# Altium project MVP-Dash-v1.0.PrjPcb (part 14 of 15)
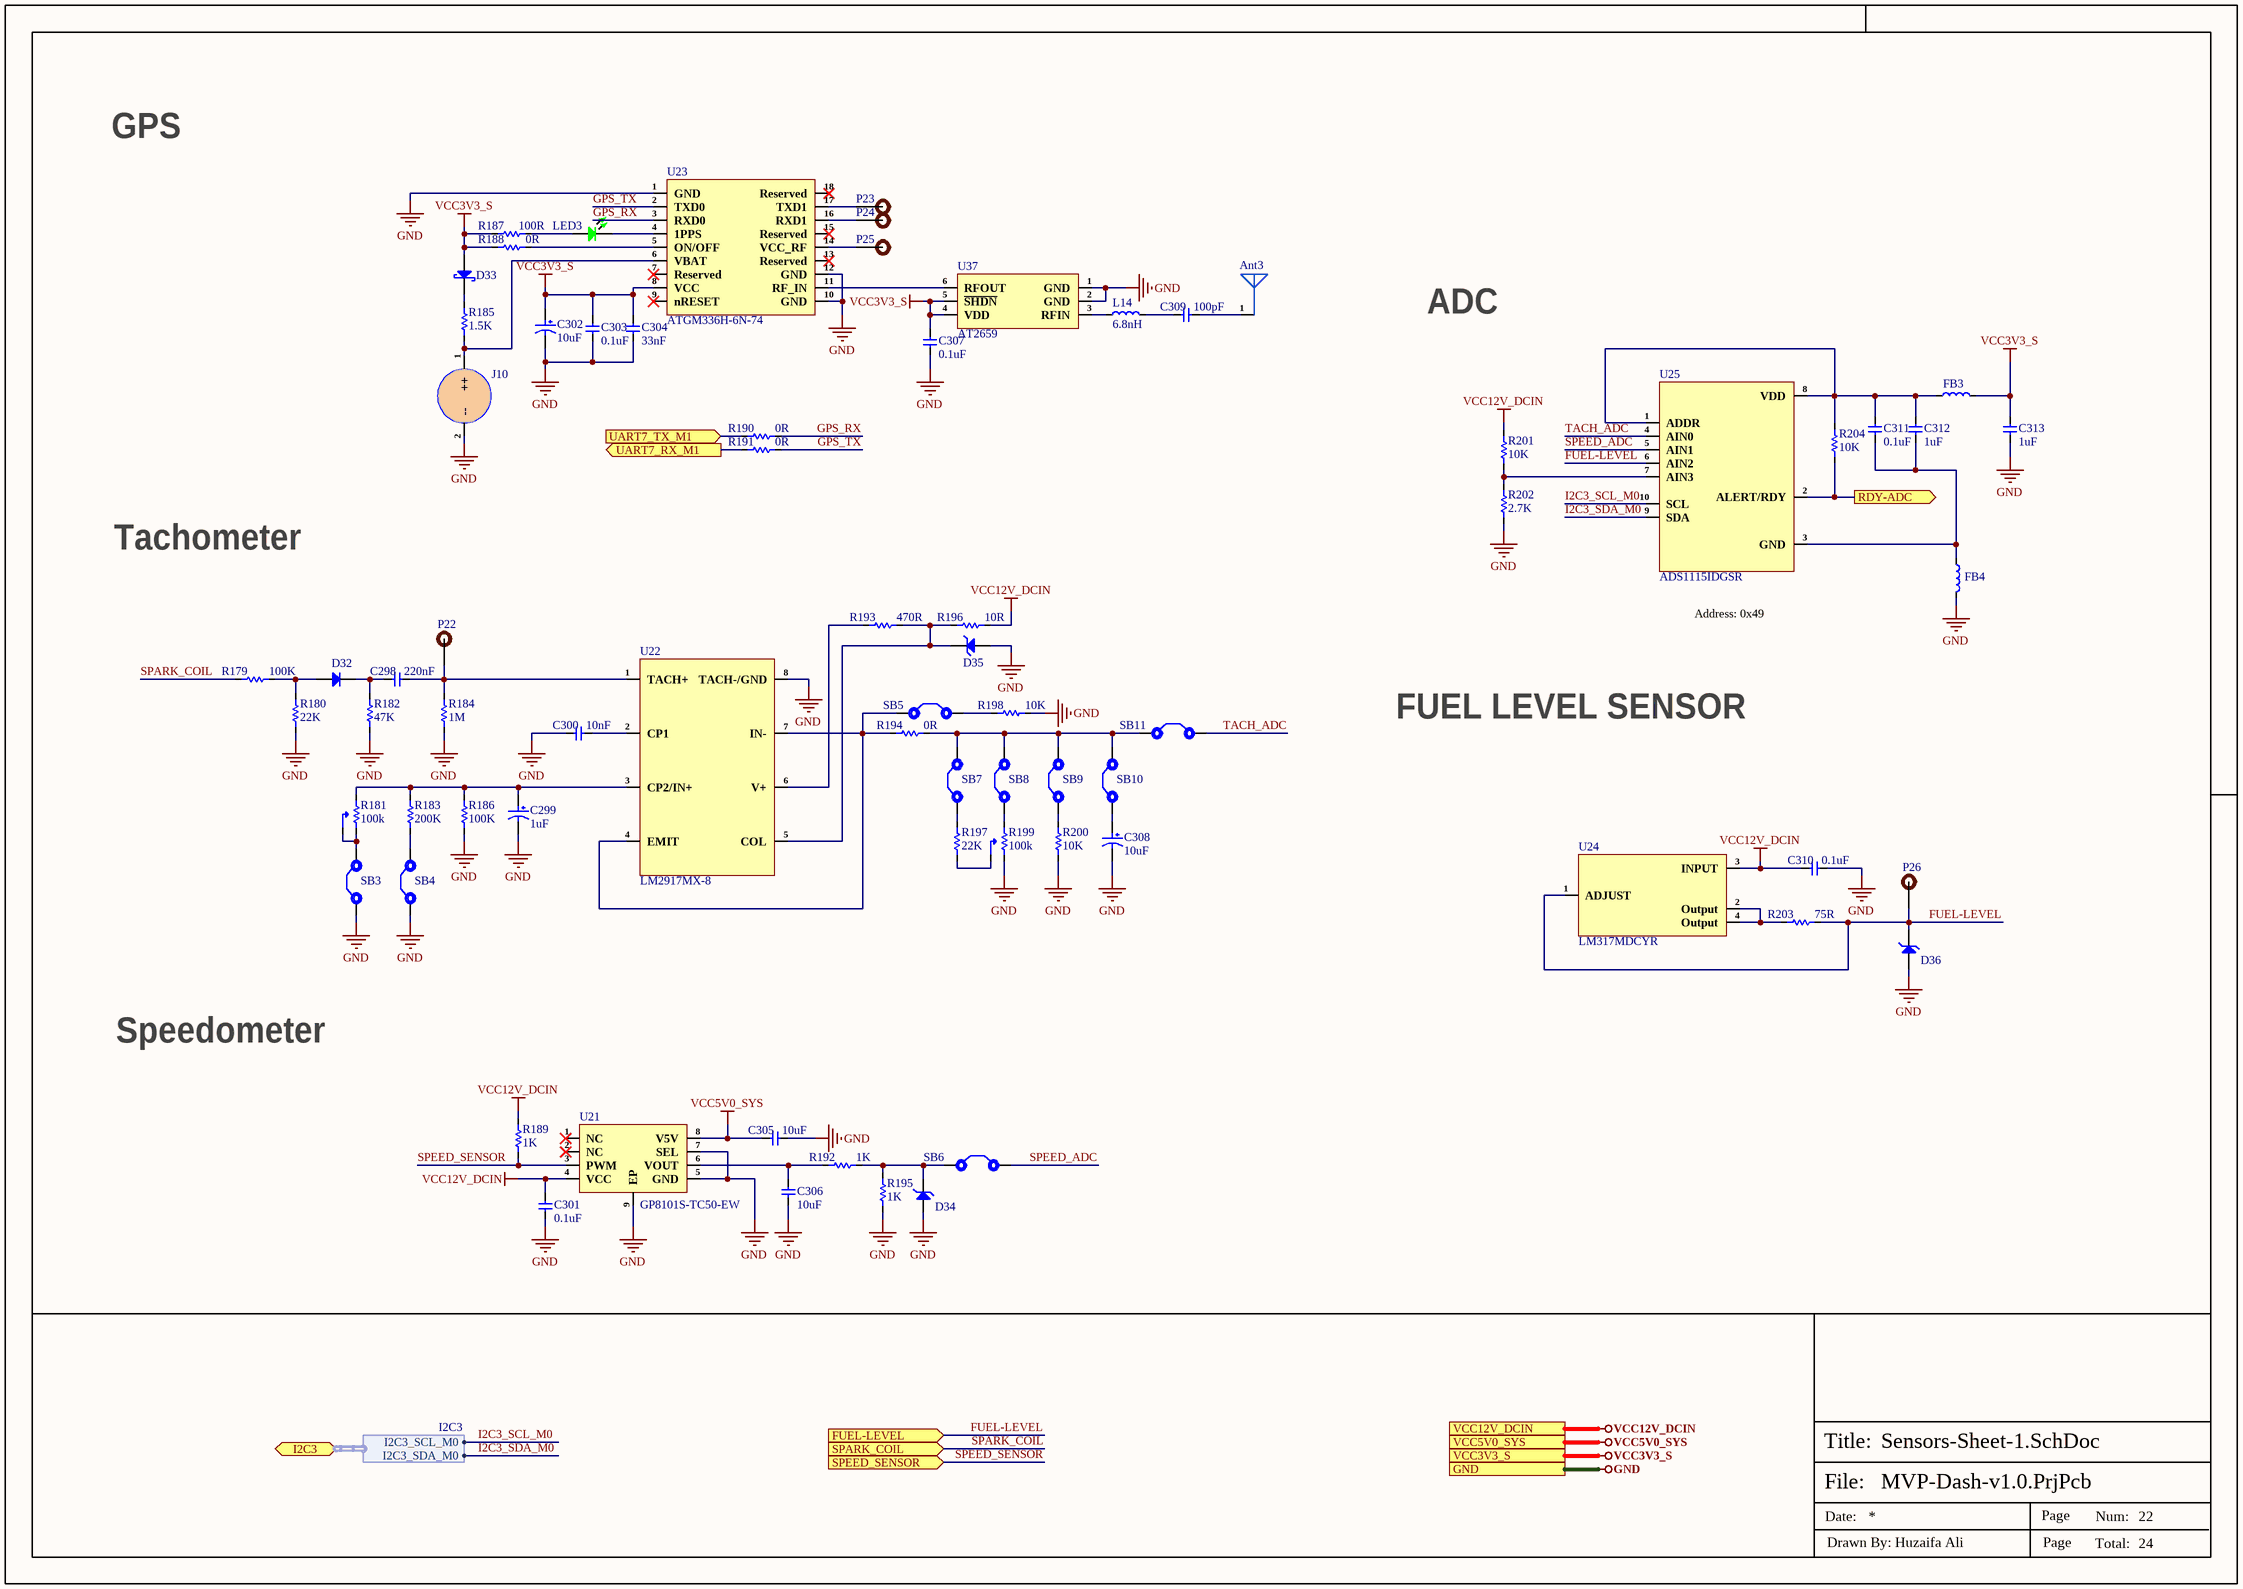
[diagram p34: Sensors-Sheet-1.SchDoc]

## Sheet Sensors-Sheet-1.SchDoc (continued)

### Library data of the parts (continued)
R196 = RC0603FR-0710RL: RES SMD 10 OHM 1% 1/10W 0603; Manufacturer: Yageo; Temperature Coefficient: 200ppm/°C; Power Rating: 100mW; Voltage Rating: 50V; Item type: Resistor; Supplier 1: Digi-Key; Manufacturer Part Number: RC0603FR-0710RL; Stock 1: 10836596; Pricing 1: 1=0.1, 10=0.046, 100=0.0187, 1000=0.0084, 2500=0.00729 (USD); Case/Package: 0603; Number of Pins: 2; Case Code (Imperial): 0603; Case Code (Metric): 1608; Contact Plating: Tin,Matte; Min Operating Temperature: -55°C; Max Operating Temperature: 155°C; Resistance: 10R; Tolerance: 1%; Composition: Thick Film; Packaging: Tape and Reel; Voltage Rating (DC): 50V; Termination: SMD/SMT; Military Standard: Not; Length: 1.6mm; Height: 0.45mm; Width: 0.8mm; Depth: 0.8mm; Radiation Hardening: No; Lead Free: Lead Free; REACH SVHC: No SVHC; ComponentLink1URL: http://www.farnell.com/datasheets/1868787.pdf?src-supplier=Element14; ComponentLink1Description: http://www.farnell.com/datasheets/1868787.pdf?src-supplier=Element14; ComponentLink2URL: http://www.yageo.com/documents/recent/PYu-RC0603_51_RoHS_L_4.pdf?src-supplier=Avnet; ComponentLink2Description: http://www.yageo.com/documents/recent/PYu-RC0603_51_RoHS_L_4.pdf?src-supplier=Avnet; ComponentLink3URL: http://documents.rs-components.com/techlib://itc_doclist_GB.htm?stockno=5048984&src-supplier=RSComponents; ComponentLink3Description: http://documents.rs-components.com/techlib://itc_doclist_GB.htm?stockno=5048984&src-supplier=RSComponents; ComponentLink4URL: http://www.yageo.com/documents/recent/PYu-RC0603_51_RoHS_L_4.pdf?src-supplier=Avnet+Europe; ComponentLink4Description: http://www.yageo.com/documents/recent/PYu-RC0603_51_RoHS_L_4.pdf?src-supplier=Avnet+Europe; Supplier Part Number 1: 311-10.0HRDKR-ND; LCSC Part Number: C109318
R198 R200 R204 = RC0402FR-0710KL: RES 10K OHM 1% 1/16W 0402; Manufacturer: Yageo; Resistance: 10kR; Voltage Rating (DC): 50V; Temperature Coefficient: 100ppm/°C; Power Rating: 62.5mW; Max Power Dissipation: 63mW; Item Type: Resistor; Supplier 1: Mouser; Manufacturer Part Number: RC0402FR-0710KL; RoHS: Yes; Category: Chip SMD Resistors; Stock 1: 18648329; Pricing 1: 1=0.10000, 10=0.01400, 50=0.01400, 100=0.00500, 1000=0.00300, 10000=0.00200 (USD); Case/Package: 0402; Number of Pins: 2; Case Code (Imperial): 0402; Case Code (Metric): 1005; Min Operating Temperature: -55°C; Max Operating Temperature: 155°C; Resistor Type: Thick Film; Tolerance: 1%; Packaging: Tape and Reel; Voltage Rating: 50V; Termination: SMD/SMT; Working Voltage: 50V; Number of Terminations: 2; Features: Moisture Resistant; Series: RC; Resistance Tolerance: 1%; Construction: Rectangular; Length: 1mm; Width: 0.5mm; Height: 0.32mm; Depth: 0.5mm; Lead Pitch: 0.2mm; REACH SVHC: No SVHC; Lead Free: Lead Free; RoHS Compliant: Yes; Military Standard: Not; ComponentLink1URL: https://datasheet.ciiva.com/7660/38568-7660787.pdf?src-supplier=Element14; ComponentLink1Description: https://datasheet.ciiva.com/7660/38568-7660787.pdf?src-supplier=Element14; ComponentLink2URL: https://datasheet.ciiva.com/7849/1686128-7849814.pdf?src-supplier=Element14; ComponentLink2Description: https://datasheet.ciiva.com/7849/1686128-7849814.pdf?src-supplier=Element14; ComponentLink3URL: https://datasheet.ciiva.com/7983/1018594-7983486.pdf?src-supplier=Element14; ComponentLink3Description: https://datasheet.ciiva.com/7983/1018594-7983486.pdf?src-supplier=Element14; ComponentLink4URL: https://datasheet.ciiva.com/22747/1018594-22747512.pdf?src-supplier=Element14; ComponentLink4Description: https://datasheet.ciiva.com/22747/1018594-22747512.pdf?src-supplier=Element14; ComponentLink5URL: https://datasheet.ciiva.com/12667/pyu-rc0402-51-rohs-l-6-r-12667067.pdf?src-supplier=Mouser; ComponentLink5Description: https://datasheet.ciiva.com/12667/pyu-rc0402-51-rohs-l-6-r-12667067.pdf?src-supplier=Mouser; ComponentLink6URL: https://datasheet.ciiva.com/7849/1784430-7849813.pdf?src-supplier=Element14; ComponentLink6Description: https://datasheet.ciiva.com/7849/1784430-7849813.pdf?src-supplier=Element14; ComponentLink7URL: https://datasheet.ciiva.com/7849/1784430-7849815.pdf?src-supplier=Element14; ComponentLink7Description: https://datasheet.ciiva.com/7849/1784430-7849815.pdf?src-supplier=Element14; Supplier Part Number 1: 603-RC0402FR-0710KL; LCSC Part Number: C60490
R201 = RT0603BRD0710KL: RES SMD 10K OHM 0.1% 1/10W 0603; Manufacturer: Yageo; Power: 100mW; Rated Temperature: 70°C; Value: 10kR; Temperature Coefficient: 25ppm/°C; Working Voltage: 75V; Package Height: 0.45mm; Package Length: 1.6mm; Package Width: 0.8mm; Item Type: Resistor; Supplier 1: Rs; Manufacturer Part Number: RT0603BRD0710KL; RoHS: Yes; Category: Chip SMD Resistors; Stock 1: 20510; Pricing 1: 100=0.29800, 250=0.27800, 500=0.25900, 1000=0.23700 (GBP); Mounting Technology: Surface Mount; Pins: 2; Case/Package: 0603; Min Operating Temperature: -55°C; Max Operating Temperature: 155°C; Tolerance: 0.1%; Resistor Type: FIXED RESISTOR; Construction: Chip; Package Style: SMTMeter; Packaging: Tape and Reel; Technology: THIN FILM; Termination: Wraparound; Reach SVHC Compliant: Yes; RoHS Compliant: Yes; ComponentLink1URL: https://datasheet.ciiva.com:443/pdfs/VipMasterIC/IC/YAGO/YAGO-S-A0008510989/YAGO-S-A0008510989-1.pdf?src-supplier=IHS+Markit; ComponentLink1Description: https://datasheet.ciiva.com:443/pdfs/VipMasterIC/IC/YAGO/YAGO-S-A0008510989/YAGO-S-A0008510989-1.pdf?src-supplier=IHS+Markit; ComponentLink2URL: https://datasheet.ciiva.com/5624/pyu-rt-1-to-0-05-rohs-l-4-5624351.pdf?src-supplier=Mouser; ComponentLink2Description: https://datasheet.ciiva.com/5624/pyu-rt-1-to-0-05-rohs-l-4-5624351.pdf?src-supplier=Mouser; ComponentLink3URL: https://datasheet.ciiva.com/29721/pyu-rt-1-to-0-05-rohs-l-4-29721177.pdf?src-supplier=Digi-Key; ComponentLink3Description: https://datasheet.ciiva.com/29721/pyu-rt-1-to-0-05-rohs-l-4-29721177.pdf?src-supplier=Digi-Key; Supplier Part Number 1: 1991391P; LCSC Part Number: C95204
R202 = RT0603BRD072K7L: RES SMD 2.7K OHM 0.1% 1/10W 0603; Manufacturer: Yageo; Manufacturer Part Number: RT0603BRD07-2K7L; Temperature Coefficient: 25ppm/°C; Voltage Rating: 75V; Power Rating: 100mW; Voltage Rating (DC): 50V; Item Type: Resistor; Resistance: 2.7kR; RoHS: Yes; Category: Chip SMD Resistors; Mount: Surface Mount; Case/Package: 0603; Contact Plating: Tin,Matte; Case Code (Metric): 1608; Case Code (Imperial): 0603; Size Code: 0603; Min Operating Temperature: -55°C; Max Operating Temperature: 125°C; Resistor Type: Thin Film; Packaging: Tape and Reel; Package Quantity: 5000; Termination: SMD/SMT; Number of Terminations: 2; Max Power Dissipation: 100mW; Features: Moisture Resistant; Series: RT; Construction: Rectangular; Length: 0.063inch; Width: 0.031inch; Height: 0.022inch; Depth: 0.8mm; Radiation Hardening: No; Military Standard: Not; Lead Free: Lead Free; RoHS Compliant: Yes; ComponentLink1URL: https://datasheet.ciiva.com/8894/pyu-rt-1-to-0-05-rohs-l-4-8894140.pdf?src-supplier=Avnet; ComponentLink1Description: https://datasheet.ciiva.com/8894/pyu-rt-1-to-0-05-rohs-l-4-8894140.pdf?src-supplier=Avnet; ComponentLink2URL: https://datasheet.ciiva.com/2585/pyu-rt-1-to-0-05-rohs-l-4-2585861.pdf?src-supplier=Digi-Key; ComponentLink2Description: https://datasheet.ciiva.com/2585/pyu-rt-1-to-0-05-rohs-l-4-2585861.pdf?src-supplier=Digi-Key; ComponentLink3URL: https://datasheet.ciiva.com/46635/pyu-rt-1-to-0-05-rohs-l-5-46635318.pdf?src-supplier=Digi-Key; ComponentLink3Description: https://datasheet.ciiva.com/46635/pyu-rt-1-to-0-05-rohs-l-5-46635318.pdf?src-supplier=Digi-Key; Supplier Part Number 1: RT0603BRD072K7L; LCSC Part Number: C705760; Supplier 1: Avnet
R203 = RC0603FR-0775RL: RES 75 OHM 1% 1/10W 0603; Manufacturer: Yageo; Temperature Coefficient: 100ppm/°C; Voltage Rating (DC): 50V; Power Rating: 100mW; Item Type: Resistor; Supplier: Digikey; Supplier Part Number: 311-75.0HRCT-ND; Manufacturer Part Number: RC0603FR-0775RL; RoHS: Yes; Category: Chip SMD Resistors; Stock: 844005; Pricing: 1=0.1, 10=0.019, 50=0.0112, 100=0.0093, 500=0.00622, 1000=0.00532 (USD); Case/Package: 0603; Case Code (Metric): 1608; Case Code (Imperial): 0603; Min Operating Temperature: -55°C; Max Operating Temperature: 155°C; Value: 75R; Tolerance: 1%; Resistor Type: Thick Film; Packaging: Tape and Reel; Voltage Rating: 50V; Package Quantity: 1; Number of Terminations: 2; Termination: SMD/SMT; Max Power Dissipation: 100mW; Features: Moisture Resistant; Series: RC; Resistance Tolerance: 1%; Construction: Rectangular; Technology: THICK FILM; Length: 0.063inch; Width: 0.031inch; Height: 0.022inch; Depth: 0.8mm; Lead Free: 5697LeadFree; Reach SVHC Compliant: No; Military Standard: Not; RoHS Compliant: Yes; LCSC Part Number: C112309
SB3-SB11 = Solder Bridge 0603: Solder Bridge ON; Manufacturer Part Number: Solder Bridge; Item Type: Solder Bridge
U21 = GP8101S-TC50-EW: ESOP-8 ADC/DAC - Specialized ROHS; Manufacturer: Guestgood; Item Type: IC; Manufacturer Part Number: GP8101S-TC50-EW; Package: ESOP-8; LCSC Part Number: C2837711; ComponentLink1Description: LCSC; ComponentLink1URL: https://www.lcsc.com/product-detail/ADC-DAC-Specialized_Guestgood-GP8101S-TC50-EW_C2837711.html
U22 = LM2917MX-8: IC F/V CONV 10KHZ 8SOIC; Manufacturer: TI National Semiconductor; Supplier: Digikey; Supplier Part Number: 296-36310-2-ND; Manufacturer Part Number: LM2917MX-8; RoHS: No; Item Type: IC; Pricing: 2500=1.20124, 5000=1.15675 (USD); Lead Free: 5698LeadFree; ComponentLink1URL: https://datasheet.ciiva.com/15145/getdatasheetpartid-629387-15145650.pdf?src-supplier=Verical; ComponentLink1Description: https://datasheet.ciiva.com/15145/getdatasheetpartid-629387-15145650.pdf?src-supplier=Verical; ComponentLink2URL: https://datasheet.ciiva.com/18553/lm2917-n-18553573.pdf?src-supplier=Digikey; ComponentLink2Description: https://datasheet.ciiva.com/18553/lm2917-n-18553573.pdf?src-supplier=Digikey; ComponentLink3URL: https://datasheet.ciiva.com/18553/lm2917-n-18553575.pdf?src-supplier=Digikey; ComponentLink3Description: https://datasheet.ciiva.com/18553/lm2917-n-18553575.pdf?src-supplier=Digikey
U23 = ATGM336H-6N-74: SMD,10.1x9.7mm Satellite Positioning Modules ROHS; Manufacturer: ZHONGKEWEI; Manufacturer Part Number: ATGM336H-6N-74; Package: SMD,10.1x9.7mm; LCSC Part Number: C5804601; ComponentLink1Description: LCSC; ComponentLink1URL: https://www.lcsc.com/product-detail/Satellite-Positioning-Modules_ZHONGKEWEI-ATGM336H-6N-74_C5804601.html
U24 = LM317MDCYR: IC REG LIN POS ADJ 500MA SOT223; Manufacturer: Texas Instruments; Output Voltage: 37V; Number of Outputs: 1; Min Input Voltage: 4.2V; Max Supply Voltage: 40V; Polarity: Positive; Min Output Voltage: 1.25V; Quiescent Current: 3.5mA; Output Type: Adjustable; Reference Voltage: 1.3V; Power Supply Rejection Ratio (PSRR): 80dB; Supplier: Mouser; Supplier Part Number: 595-LM317MDCYR; Manufacturer Part Number: LM317MDCYR; RoHS: Yes; Category: Voltage Regulators - Linear; Stock: 12890; Pricing: 1=0.67, 10=0.564, 50=0.564, 100=0.428, 500=0.359, 1000=0.283, 2500=0.263, 5000=0.245, 10000=0.236, 25000=0.227 (USD); Mounting Technology: Surface Mount; Case/Package: SOT-223-4; Pins: 4; Weight: 0.006632oz; Min Operating Temperature: -40°C; Max Operating Temperature: 125°C; Packaging: Tape and Reel; Output Current: 500mA; Number of Regulators: 1; Max Output Voltage: 37V; Package Quantity: 1; Max Output current: 500mA; Series: -; Radiation Hardening: No; Reach SVHC Compliant: No; Lead Free: Lead Free; RoHS Compliant: Yes; ComponentLink1URL: https://datasheet.ciiva.com/1643/755612-1643356.pdf?src-supplier=Newark; ComponentLink1Description: https://datasheet.ciiva.com/1643/755612-1643356.pdf?src-supplier=Newark; ComponentLink2URL: https://datasheet.ciiva.com/41458/001014040-da-01-en-ic-reg-adj-0-5-lm317mdcyr-sot-223-4-tid-41458215.pdf?src-supplier=Conrad; ComponentLink2Description: https://datasheet.ciiva.com/41458/001014040-da-01-en-ic-reg-adj-0-5-lm317mdcyr-sot-223-4-tid-41458215.pdf?src-supplier=Conrad; ComponentLink3URL: https://datasheet.ciiva.com/1512/1814942-1512040.pdf?src-supplier=Element14; ComponentLink3Description: https://datasheet.ciiva.com/1512/1814942-1512040.pdf?src-supplier=Element14; ComponentLink4URL: https://datasheet.ciiva.com/46398/755612-46398903.pdf?src-supplier=Element14; ComponentLink4Description: https://datasheet.ciiva.com/46398/755612-46398903.pdf?src-supplier=Element14; ComponentLink5URL: https://datasheet.ciiva.com/46419/1814942-46419370.pdf?src-supplier=Element14; ComponentLink5Description: https://datasheet.ciiva.com/46419/1814942-46419370.pdf?src-supplier=Element14; ComponentLink6URL: https://datasheet.ciiva.com/2042/lm317m-2042100.pdf?src-supplier=Digikey; ComponentLink6Description: https://datasheet.ciiva.com/2042/lm317m-2042100.pdf?src-supplier=Digikey; ComponentLink7URL: https://datasheet.ciiva.com/2042/lm317m-2042099.pdf?src-supplier=Digikey; ComponentLink7Description: https://datasheet.ciiva.com/2042/lm317m-2042099.pdf?src-supplier=Digikey; ComponentLink8URL: https://datasheet.ciiva.com/2042/lm317m-2042101.pdf?src-supplier=Digikey; ComponentLink8Description: https://datasheet.ciiva.com/2042/lm317m-2042101.pdf?src-supplier=Digikey; ComponentLink9URL: https://datasheet.ciiva.com/14280/lm317mq-14280776.pdf?src-supplier=Avnet; ComponentLink9Description: https://datasheet.ciiva.com/14280/lm317mq-14280776.pdf?src-supplier=Avnet; LCSC Part Number: C840113; Item Type: IC
U25 = ADS1115IDGSR: IC ADC 16BIT SIGMA-DELTA 10VSSOP; Manufacturer: Texas Instruments; Interface: I2C; Number of Bits: 16; Sampling Rate: 860S/s; Number of A/D Converters: 1; Resolution: 16b; Polarity: Bipolar; Min Supply Voltage: 2V; Max Supply Voltage: 5.5V; Supply Type: Single; Conversion Rate: 0.86KS/s; Number of Inputs: 4; Integral Nonlinearity (INL): 1LSB; Power Dissipation: 900uW; Nominal Supply Current: 150uA; Number of Channels: 2; Supplier: Mouser; Supplier Part Number: 595-ADS1115IDGSR; Manufacturer Part Number: ADS1115IDGSR; RoHS: Yes; Category: Analog to Digital Converters (ADCs); Stock: 5925; Pricing: 1=5.44, 10=4.76, 50=4.76, 100=4.01, 1000=2.88, 10000=2.78 (USD); Case/Package: VSSOP; Pins: 10; Contact Plating: Gold; Min Operating Temperature: -40°C; Max Operating Temperature: 125°C; Package Quantity: 2500; Packaging: Tape and Reel; Number of Converters: 1; Max Supply Voltage (DC): 5.5V; Min Supply Voltage (DC): 2V; Series: -; Length: 3mm; Width: 3mm; Height: 1.07mm; Thickness: 1.02mm; Reach SVHC Compliant: No; Lead Free: Lead Free; RoHS Compliant: Yes; ComponentLink1URL: https://datasheet.ciiva.com/4031/47725463s8438921n7713-4031028.pdf?src-supplier=Arrow+Electronics; ComponentLink1Description: https://datasheet.ciiva.com/4031/47725463s8438921n7713-4031028.pdf?src-supplier=Arrow+Electronics; LCSC Part Number: C37593; Item Type: IC
U37 = AT2659: 1.4V~3.6V 4.3mA DFN-6(1x1.6) Low Noise Amplifiers (LNA) - RF ROHS; Manufacturer: ZHONGKEWEI; Manufacturer Part Number: AT2659; Package: DFN-6(1x1.6); LCSC Part Number: C92450; Item Type: LNA; ComponentLink1Description: LCSC; ComponentLink1URL: https://www.lcsc.com/product-detail/Low-Noise-Amplifiers-LNA-RF_ZHONGKEWEI-AT2659_C92450.html

## Sheet Sensors-Sheet-2.SchDoc
size 420 x 297 mm; SheetNumber: 24; SheetTotal: 25
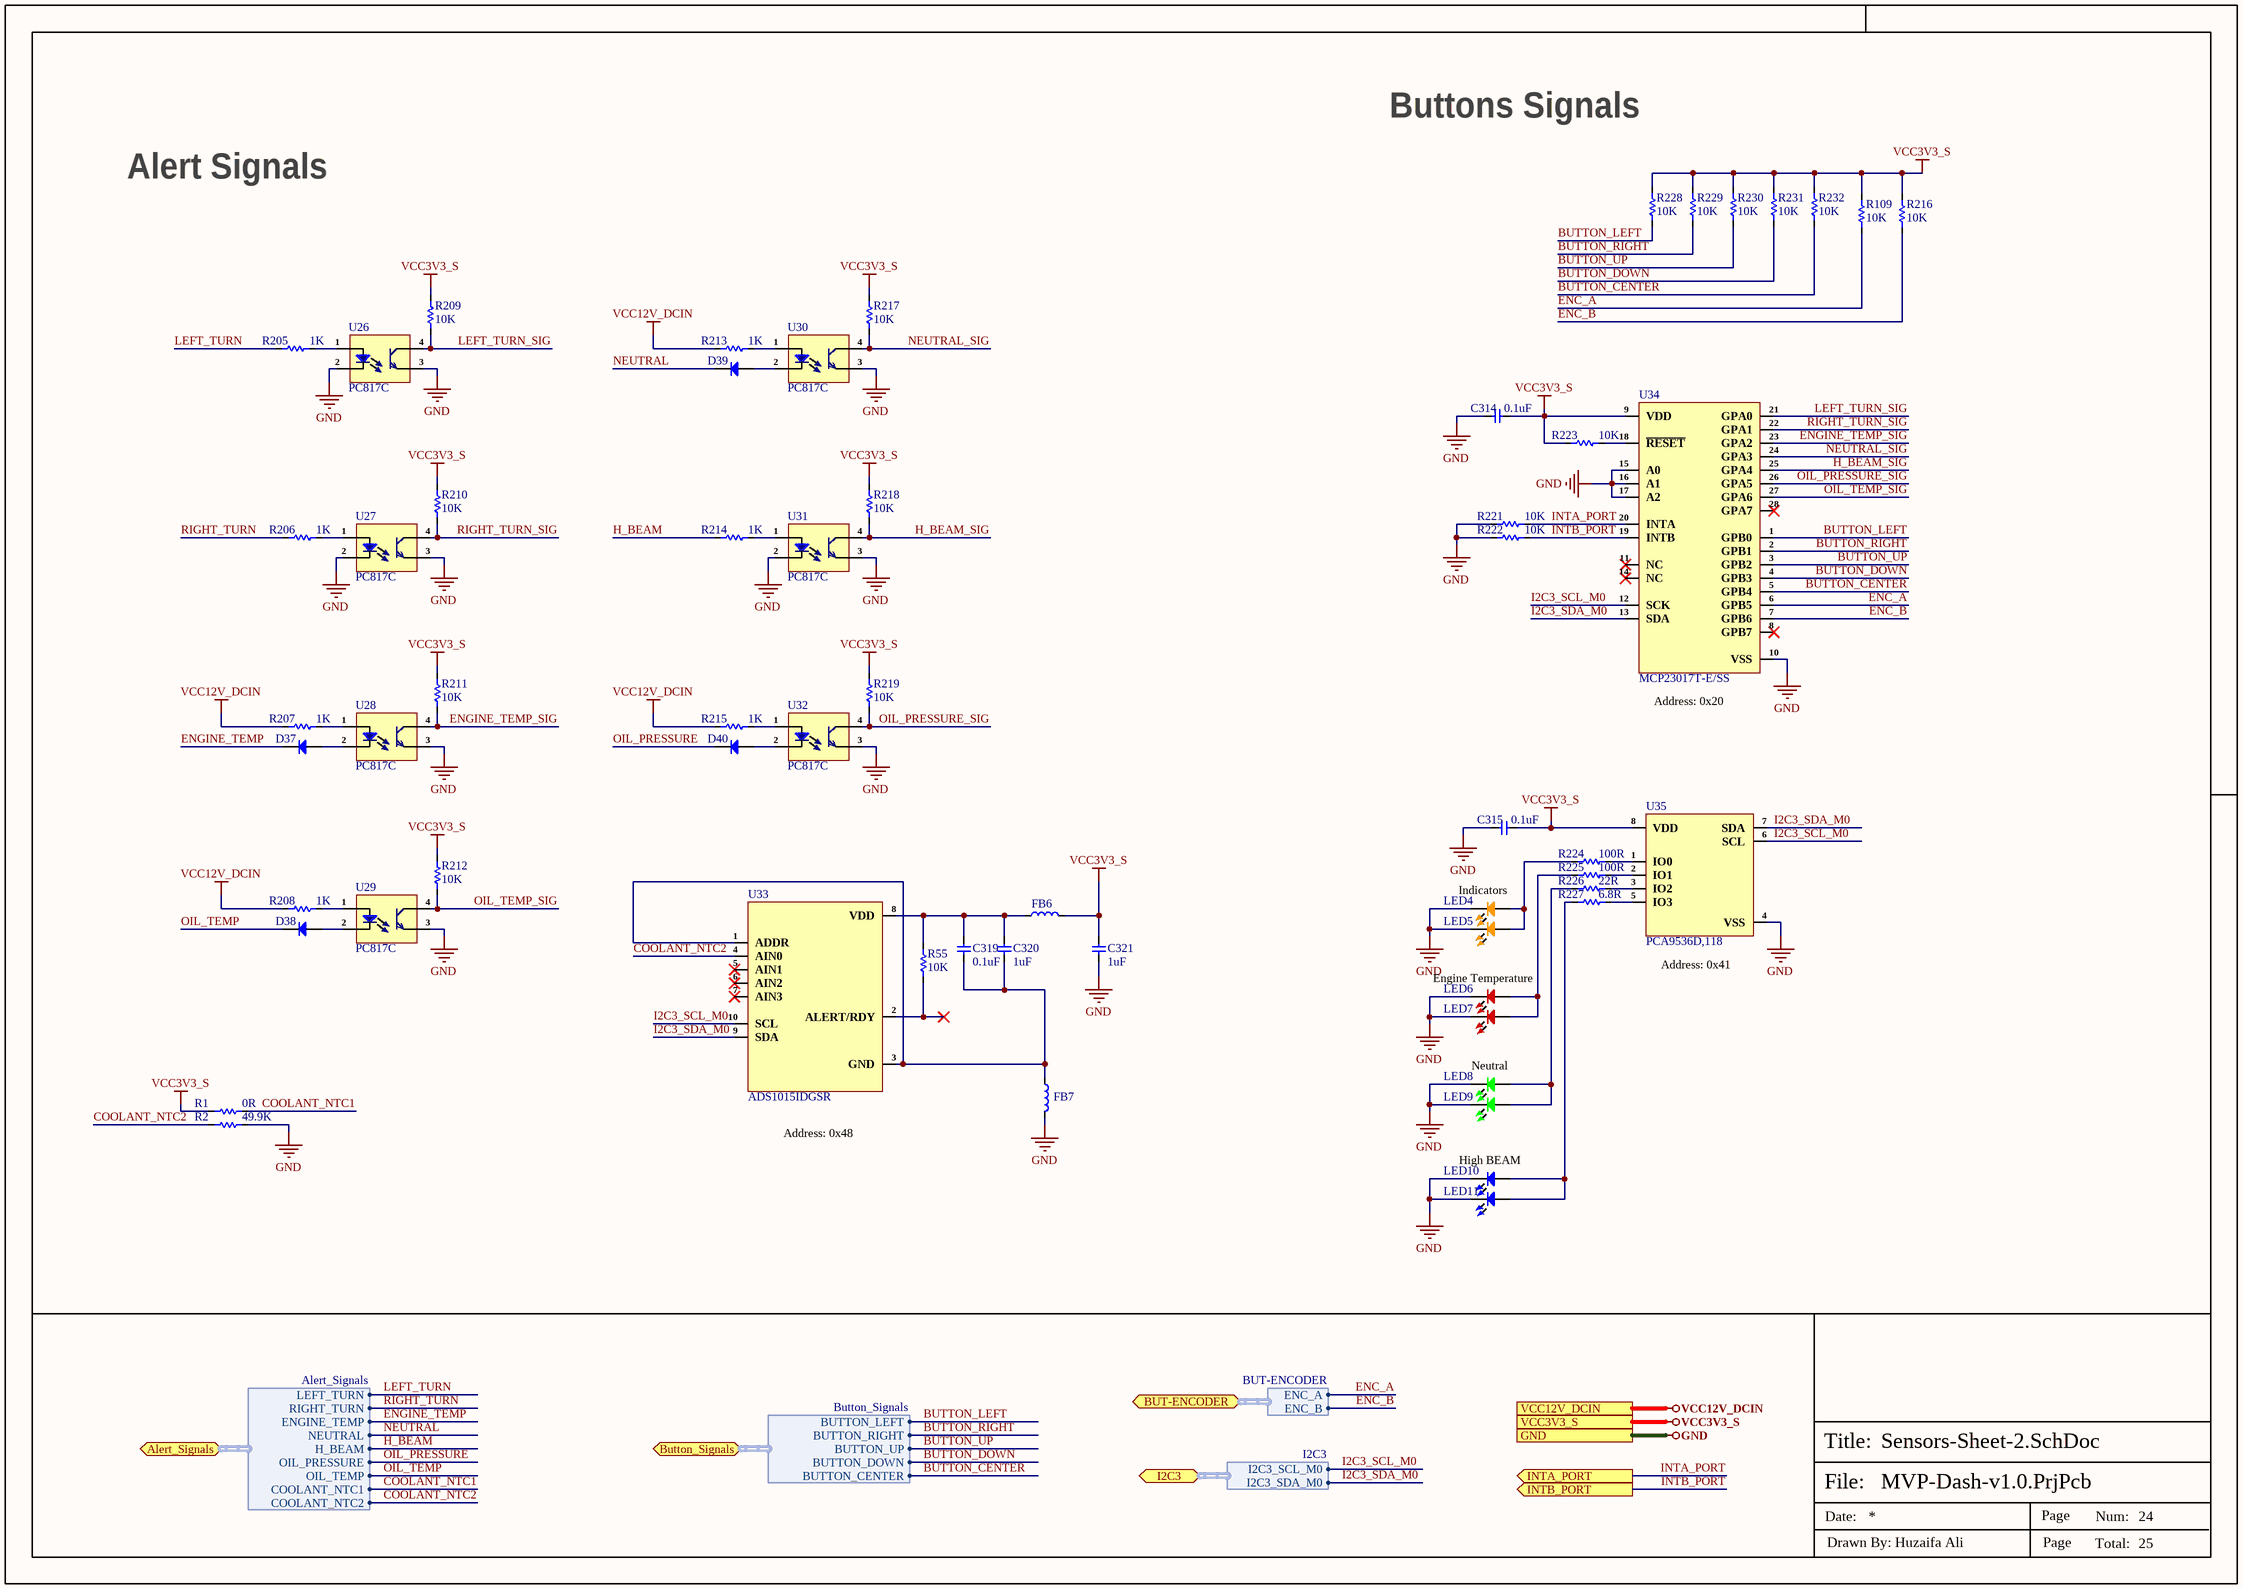
[diagram p31: Sensors-Sheet-2.SchDoc]

### Parts
C314  0.1uF  [Cap-0402]
C315  0.1uF  [Cap-0402]
C319  0.1uF  [Cap-0402]
C320  1uF  [Cap-0402]
C321  1uF  [Cap-0402]
D37  1N4148W  [SOD-123]  (value not drawn)
D38  1N4148W  [SOD-123]  (value not drawn)
D39  1N4148W  [SOD-123]  (value not drawn)
D40  1N4148W  [SOD-123]  (value not drawn)
FB6  MMZ2012R102ATD25  [Ind-0805]  (value not drawn)
FB7  MMZ2012R102ATD25  [Ind-0805]  (value not drawn)
LED4  NCD0603O2  [LED-0603]  (value not drawn)
LED5  NCD0603O2  [LED-0603]  (value not drawn)
LED6  RED  [LED-0603]  (value not drawn)
LED7  RED  [LED-0603]  (value not drawn)
LED8  Emerald  [LED-0603]  (value not drawn)
LED9  Emerald  [LED-0603]  (value not drawn)
LED10  Blue  [LED-0603]  (value not drawn)
LED11  Blue  [LED-0603]  (value not drawn)
R1  0R  [Res-0402]
R2  49.9K  [Res-0402]
R55  10K  [Res-0402]
R109  10K  [Res-0402]
R205  1K  [Res-0402]
R206  1K  [Res-0402]
R207  1K  [Res-0402]
R208  1K  [Res-0402]
R209  10K  [Res-0402]
R210  10K  [Res-0402]
R211  10K  [Res-0402]
R212  10K  [Res-0402]
R213  1K  [Res-0402]
R214  1K  [Res-0402]
R215  1K  [Res-0402]
R216  10K  [Res-0402]
R217  10K  [Res-0402]
R218  10K  [Res-0402]
R219  10K  [Res-0402]
R221  10K  [Res-0402]
R222  10K  [Res-0402]
R223  10K  [Res-0402]
R224  100R  [Res-0603]
R225  100R  [Res-0603]
R226  22R  [Res-0603]
R227  6.8R  [Res-0603]
R228  10K  [Res-0402]
R229  10K  [Res-0402]
R230  10K  [Res-0402]
R231  10K  [Res-0402]
R232  10K  [Res-0402]
U26  PC817C  [PC817C]
U27  PC817C  [PC817C]
U28  PC817C  [PC817C]
U29  PC817C  [PC817C]
U30  PC817C  [PC817C]
U31  PC817C  [PC817C]
U32  PC817C  [PC817C]
U33  ADS1015IDGSR  [VSSOP-10]
U34  MCP23017T-E/SS  [SSOP-28-208mil]
U35  PCA9536D,118  [SOP-8]

### Ports
Alert_Signals (bidir, harness Alert_Signals, see Connector-Sheet[2D]), BUT-ENCODER (bidir, harness BUT-ENCODER, see Connector-Sheet[3D]), Button_Signals (bidir, harness Button_Signals, see Connector-Sheet[3D]), GND (see CAN-Bus-SPI-Flash-Sheet[4D], Connector-Sheet[5D], DRAM-LPDDR4x-Sheet[4D], eMMC-Sheet[4D], LED-Debug-Sheet[4D], Power-DC-IN-Sheet[4D], Power-Others-Sheet[4D], Power-PMIC-Sheet[4D], RK3568-Audio-Interface[4D], RK3568-Flash-SD-Controller[4D], RK3568-OSC-PMUIO-Sheet[5D], RK3568-Power-Sheet[4D], RK3568-SARADC-GPIO[4D], RK3568-USB-PCIe-Sheet[5D], RK3568-VI-Interface-Sheet[4D], RK3568-VO-Interface-1[4D], RK3568-VO-Interface-2[4D], Sensors-Sheet-1[4D], Type-C-Sheet[4D], USB-Ports[4D], VO-HDMI2.0-TX-Sheet[4D], VO-LCM-MIPI-DSI-TX0[4D], WIFI-BT-SDIO-Sheet[4D]), I2C3 (bidir, harness I2C3, see RK3568-Audio-Interface[3D], Sensors-Sheet-1[1D]), INTA_PORT (out, see RK3568-OSC-PMUIO-Sheet[5B]), INTB_PORT (out, see RK3568-OSC-PMUIO-Sheet[5C]), VCC3V3_S (see LED-Debug-Sheet[4D], Power-DC-IN-Sheet[4D], Sensors-Sheet-1[4D], Type-C-Sheet[4D], VO-LCM-MIPI-DSI-TX0[4D], WIFI-BT-SDIO-Sheet[4D]), VCC12V_DCIN (see Connector-Sheet[5D], Power-DC-IN-Sheet[4D], Sensors-Sheet-1[4D])

### Harnesses
I2C3: I2C3_SCL_M0, I2C3_SDA_M0
Button_Signals: BUTTON_LEFT, BUTTON_RIGHT, BUTTON_UP, BUTTON_DOWN, BUTTON_CENTER
Alert_Signals: LEFT_TURN, RIGHT_TURN, ENGINE_TEMP, NEUTRAL, H_BEAM, OIL_PRESSURE, OIL_TEMP, COOLANT_NTC1, COOLANT_NTC2
BUT-ENCODER: ENC_A, ENC_B

### Nets
GND: C314.2 C315.2 C321.2 FB7.2 LED4.2 LED5.2 LED6.2 LED7.2 LED8.2 LED9.2 LED10.2 LED11.2 R2.2 R221.2 R222.2 U26.2(Ca) U26.3(E) U27.2(Ca) U27.3(E) U28.3(E) U29.3(E) U30.3(E) U31.2(Ca) U31.3(E) U32.3(E) U34.10(VSS) U34.15(A0) U34.16(A1) U34.17(A2) U35.4(VSS) ; port GND
VCC3V3_S: C314.1 C315.1 C321.1 FB6.2 R1.1 R109.2 R209.2 R210.2 R211.2 R212.2 R216.2 R217.2 R218.2 R219.2 R223.2 R228.2 R229.2 R230.2 R231.2 R232.2 U34.9(VDD) U35.8(VDD) ; port VCC3V3_S
VCC12V_DCIN: R207.1 R208.1 R213.1 R215.1 ; port VCC12V_DCIN
BUTTON_CENTER: R232.1 U34.5(GPB4) ; port Button_Signals.BUTTON_CENTER
BUTTON_DOWN: R231.1 U34.4(GPB3) ; port Button_Signals.BUTTON_DOWN
BUTTON_LEFT: R228.1 U34.1(GPB0) ; port Button_Signals.BUTTON_LEFT
BUTTON_RIGHT: R229.1 U34.2(GPB1) ; port Button_Signals.BUTTON_RIGHT
BUTTON_UP: R230.1 U34.3(GPB2) ; port Button_Signals.BUTTON_UP
COOLANT_NTC1: R1.2 ; port Alert_Signals.COOLANT_NTC1
COOLANT_NTC2: R2.1 U33.4(AIN0) ; port Alert_Signals.COOLANT_NTC2
ENC_A: R109.1 U34.6(GPB5) ; port BUT-ENCODER.ENC_A
ENC_B: R216.1 U34.7(GPB6) ; port BUT-ENCODER.ENC_B
ENGINE_TEMP: D37.2(K) ; port Alert_Signals.ENGINE_TEMP
ENGINE_TEMP_SIG: R211.1 U28.4(C) U34.23(GPA2)
H_BEAM: R214.1 ; port Alert_Signals.H_BEAM
H_BEAM_SIG: R218.1 U31.4(C) U34.25(GPA4)
I2C3_SCL_M0: U33.10(SCL) U34.12(SCK) U35.6(SCL) ; port I2C3.I2C3_SCL_M0
I2C3_SDA_M0: U33.9(SDA) U34.13(SDA) U35.7(SDA) ; port I2C3.I2C3_SDA_M0
INTA_PORT: R221.1 U34.20(INTA) ; port INTA_PORT
INTB_PORT: R222.1 U34.19(INTB) ; port INTB_PORT
LEFT_TURN: R205.1 ; port Alert_Signals.LEFT_TURN
LEFT_TURN_SIG: R209.1 U26.4(C) U34.21(GPA0)
NEUTRAL: D39.2(K) ; port Alert_Signals.NEUTRAL
NEUTRAL_SIG: R217.1 U30.4(C) U34.24(GPA3)
OIL_PRESSURE: D40.2(K) ; port Alert_Signals.OIL_PRESSURE
OIL_PRESSURE_SIG: R219.1 U32.4(C) U34.26(GPA5)
OIL_TEMP: D38.2(K) ; port Alert_Signals.OIL_TEMP
OIL_TEMP_SIG: R212.1 U29.4(C) U34.27(GPA6)
RIGHT_TURN: R206.1 ; port Alert_Signals.RIGHT_TURN
RIGHT_TURN_SIG: R210.1 U27.4(C) U34.22(GPA1)
NetC319_1: C319.1 C320.1 FB6.1 R55.2 U33.8(VDD)
NetC319_2: C319.2 C320.2 FB7.1 U33.1(ADDR) U33.3(GND)
NetD37_1: D37.1(A) U28.2(Ca)
NetD38_1: D38.1(A) U29.2(Ca)
NetD39_1: D39.1(A) U30.2(Ca)
NetD40_1: D40.1(A) U32.2(Ca)
NetLED4_1: LED4.1 LED5.1 R224.1
NetLED6_1: LED6.1 LED7.1 R225.1
NetLED8_1: LED8.1 LED9.1 R226.1
NetLED10_1: LED10.1 LED11.1 R227.1
NetR55_1: R55.1 U33.2(ALERT/RDY)
NetR205_2: R205.2 U26.1(An)
NetR206_2: R206.2 U27.1(An)
NetR207_2: R207.2 U28.1(An)
NetR208_2: R208.2 U29.1(An)
NetR213_2: R213.2 U30.1(An)
NetR214_2: R214.2 U31.1(An)
NetR215_2: R215.2 U32.1(An)
NetR223_1: R223.1 U34.18(~{RESET})
NetR224_2: R224.2 U35.1(IO0)
NetR225_2: R225.2 U35.2(IO1)
NetR226_2: R226.2 U35.3(IO2)
NetR227_2: R227.2 U35.5(IO3)

Not connected (* = marked no-connect by the designer): U33 5(AIN1)* 6(AIN2)* 7(AIN3)*; U34 8(GPB7)* 11(NC)* 14(NC)* 28(GPA7)*

### Notes on the sheet
- Buttons Signals
- Alert Signals
- (near U34) Address: 0x20
- (near LED4) Indicators
- (near LED6) Engine Temperature
- (near U35) Address: 0x41
- (near LED8) Neutral
- Address: 0x48
- (near LED10) High BEAM
- File:
- Title:
- Date:
- Page
- Num:
- Total:
- Drawn By: Huzaifa Ali

### Library data of the parts
C314 C315 = CC0402KRX5R6BB104: CAP CER 0.1UF 10V X5R 0402; Manufacturer: Yageo; Capacitance: 100nF; Tolerance: 10%; Dissipation Factor: 5%; Insulation Resistance: 10GR; Item Type: Capacitor; Supplier 1: Digi-Key; Manufacturer Part Number: CC0402KRX5R6BB104; RoHS: Yes; Category: Ceramic Capacitors; Stock 1: 6385580; Pricing 1: 1=0.10000, 10=0.02700, 50=0.01500, 100=0.01220, 500=0.00874, 1000=0.00687, 2500=0.00625, 5000=0.00575 (USD); Mount: Surface Mount; Case/Package: 0402; Number of Pins: 2; Case Code (Imperial): 0402; Case Code (Metric): 1005; Min Operating Temperature: -55°C; Max Operating Temperature: 85°C; Dielectric: X5R; Packaging: Tape and Reel; Voltage Rating: 10V; Package Quantity: 1; Termination: SMD/SMT; Voltage Rating (DC): 10V; Series: CC; Length: 1mm; Width: 0.02inch; Height: 0.5mm; Depth: 0.5mm; Thickness: 0.022inch; Radiation Hardening: No; RoHS Compliant: Yes; REACH SVHC: No SVHC; Lead Free: Lead Free; Halogen Free: Halogen Free; ComponentLink1URL: https://datasheet.ciiva.com/144/mlccorderingcode-144029.pdf?src-supplier=Digi-Key; ComponentLink1Description: https://datasheet.ciiva.com/144/mlccorderingcode-144029.pdf?src-supplier=Digi-Key; ComponentLink2URL: https://datasheet.ciiva.com/144/mlccorderingcode-144028.pdf?src-supplier=Digi-Key; ComponentLink2Description: https://datasheet.ciiva.com/144/mlccorderingcode-144028.pdf?src-supplier=Digi-Key; ComponentLink3URL: https://datasheet.ciiva.com/144/mlccorderingcode-144030.pdf?src-supplier=Digi-Key; ComponentLink3Description: https://datasheet.ciiva.com/144/mlccorderingcode-144030.pdf?src-supplier=Digi-Key; ComponentLink4URL: https://datasheet.ciiva.com/7978/1359354-7978091.pdf?src-supplier=Element14; ComponentLink4Description: https://datasheet.ciiva.com/7978/1359354-7978091.pdf?src-supplier=Element14; ComponentLink5URL: https://datasheet.ciiva.com/11587/upy-gphc-x5r-4v-to-50v-12-11587302.pdf?src-supplier=Avnet; ComponentLink5Description: https://datasheet.ciiva.com/11587/upy-gphc-x5r-4v-to-50v-12-11587302.pdf?src-supplier=Avnet; Supplier Part Number 1: 311-1336-1-ND; LCSC Part Number: C129131
C319 = CL05B104KB54PNC: CAP CER 0.1UF 50V X7R 0402; Manufacturer: Samsung; Supplier 1: Digi-Key; Manufacturer Part Number: CL05B104KB54PNC; Stock 1: 8594; Pricing 1: 1=0.1, 10=0.067, 50=0.0366, 100=0.0299, 500=0.02138, 1000=0.01681, 2500=0.01528, 5000=0.01406 (USD); Supplier Part Number 1: 1276-CL05B104KB54PNCDKR-ND; LCSC Part Number: C307331
C320 C321 = CL05A105KA5NQNC: CAP CER 1UF 25V X5R 0402; Manufacturer: Samsung; Material: Ceramic; Tolerance: 10%; Item Type: Capacitor; Supplier 1: Arrow Electronics; Manufacturer Part Number: CL05A105KA5NQNC; RoHS: Yes; Category: Ceramic Capacitors; Stock 1: 80000; Pricing 1: 10000=0.0256, 20000=0.0238, 30000=0.0228, 50000=0.0207, 100000=0.0175, 250000=0.0157 (USD); Mounting Technology: Surface Mount; Case/Package: 0402; Case Code (Metric): 1005; Case Code (Imperial): 0402; Min Operating Temperature: -55°C; Max Operating Temperature: 85°C; Package Quantity: 10000; Series: CL; Voltage Rating: 25V; Packaging: Tape and Reel; Construction: Flat; Value: 1uF; Dielectric: X5R; Length: 1mm; Width: 0.02inch; Height: 0.5mm; Depth: 0.5mm; Thickness: 0.022inch; Radiation Hardening: No; Lead Free: Lead Free; RoHS Compliant: Yes; ComponentLink1URL: https://datasheet.ciiva.com/25720/cl05a105ka5nqnc-25720771.pdf?src-supplier=Digi-Key; ComponentLink1Description: https://datasheet.ciiva.com/25720/cl05a105ka5nqnc-25720771.pdf?src-supplier=Digi-Key; ComponentLink2URL: https://datasheet.ciiva.com/3777/cl05a105ka5nqnc-3777709.pdf?src-supplier=Arrow+Electronics; ComponentLink2Description: https://datasheet.ciiva.com/3777/cl05a105ka5nqnc-3777709.pdf?src-supplier=Arrow+Electronics; ComponentLink3URL: https://datasheet.ciiva.com/29198/459147-da-01-en-vs-kondensator-0402-29198339.pdf?src-supplier=Conrad; ComponentLink3Description: https://datasheet.ciiva.com/29198/459147-da-01-en-vs-kondensator-0402-29198339.pdf?src-supplier=Conrad; Supplier Part Number 1: CL05A105KA5NQNC; LCSC Part Number: C52923
D37-D40 = 1N4148W: 100V 400mW Single 1.25V@150mA 8ns 300mA SOD-123 Switching Diode ROHS; Manufacturer: JSMSEMI; ComponentLink1Description: LCSC; ComponentLink1URL: https://www.lcsc.com/product-detail/Switching-Diode_JSMSEMI-1N4148W_C917030.html; Manufacturer Part Number: 1N4148W; Package: SOD-123; LCSC Part Number: C917030; Item Type: Diode
FB6 FB7 = MMZ2012R102ATD25: FERRITE BEAD 1K OHM 0805 1LN; Manufacturer: TDK; Number of Lines: 1; Max Current Rating: 500mA; DC Resistance (DCR): 300mR; Impedance: 1kR; Tolerance: 25%; Test Frequency: 100MHz; Supplier 1: Digi-Key; Manufacturer Part Number: MMZ2012R102ATD25; RoHS: Yes; Category: Ferrite Beads and Chips; Stock 1: 2942; Pricing 1: 1=0.11000, 10=0.09200, 25=0.08280, 50=0.06080, 100=0.05240, 250=0.04140, 500=0.03496, 1000=0.02944 (USD); Mount: Surface Mount; Case/Package: 0805; Case Code (Metric): 2012; Case Code (Imperial): 0805; Weight: 0.000194oz; Min Operating Temperature: -55°C; Max Operating Temperature: 125°C; Package Quantity: 4000; Packaging: Tape and Reel; Termination: SMD/SMT; Max DC Current: 500mA; Length: 0.079inch; Width: 0.049inch; Height: 0.041inch; Ratings: AEC-Q200; RoHS Compliant: Yes; ComponentLink1URL: http://www.mouser.com/ds/2/400/beads_automotive_signal_mmz_en-469244.pdf?src-supplier=Mouser; ComponentLink1Description: http://www.mouser.com/ds/2/400/beads_automotive_signal_mmz_en-469244.pdf?src-supplier=Mouser; ComponentLink2URL: https://product.tdk.com/info/en/catalog/datasheets/beads_automotive_signal_mmz2012_en.pdf?src-supplier=Digi-Key; ComponentLink2Description: https://product.tdk.com/info/en/catalog/datasheets/beads_automotive_signal_mmz2012_en.pdf?src-supplier=Digi-Key; Supplier Part Number 1: 445-MMZ2012R102ATD25CT-ND; LCSC Part Number: C307765; Item Type: Ferrite Bead
LED4 LED5 = NCD0603O2: 20mA 100mcd~220mcd 600nm~610nm -30℃~+85℃ Orange 130° 65mW 1.6V~2.6V 0603 Light Emitting Diodes (LED) ROHS; Manufacturer: FOSHAN Nationstar Optoelectronics; Supplier: LCSC; LCSC Part Number: C108553; Manufacturer Part Number: NCD0603O2; RoHS: No; Item Type: LED
LED6 LED7 = NCD0603R3: RED LED 0603 Light Emitting Diodes; Manufacturer: Foshan NationStar Optoelectronics; Manufacturer Part Number: NCD0603R3; Package: 0603; Item Type: LED; LCSC Part Number: C3151730; ComponentLink1Description: LCSC; ComponentLink1URL: https://www.lcsc.com/product-detail/Light-Emitting-Diodes-LED_Foshan-NationStar-Optoelectronics-NCD0603R3_C3151730.html
LED8 LED9 = NCD0603G2: Emerald 0603 Light Emitting Diodes (LED) ROHS; Manufacturer: Foshan NationStar Optoelectronics; Manufacturer Part Number: NCD0603G2; Package: 0603; LCSC Part Number: C87326; Item Type: LED; ComponentLink1Description: LCSC; ComponentLink1URL: https://www.lcsc.com/product-detail/Light-Emitting-Diodes-LED_Foshan-NationStar-Optoelectronics-NCD0603G2_C87326.html
LED10 LED11 = NCD0603B3: blue 0603 Light Emitting Diodes (LED) ROHS; Manufacturer: Foshan NationStar Optoelectronics; Manufacturer Part Number: NCD0603B3; Package: 0603; LCSC Part Number: C158101; Item Type: LED; ComponentLink1Description: LCSC; ComponentLink1URL: https://www.lcsc.com/product-detail/Light-Emitting-Diodes-LED_Foshan-NationStar-Optoelectronics-NCD0603B3_C158101.html
R1 = RC0402FR-070RL: RES 0 OHM JUMPER 1/16W 0402; Manufacturer: Yageo; Tolerance: 1%; Power Rating: 62.5mW; Voltage Rating: 50V; Temperature Coefficient: 200ppm/°C; Max Power Dissipation: 63mW; Supplier 1: Mouser; Manufacturer Part Number: RC0402FR-070RL; RoHS: Yes; Category: Chip SMD Resistors; Stock 1: 8556842; Pricing 1: 1=0.10000, 10=0.01400, 50=0.01400, 100=0.00600, 1000=0.00300, 5000=0.00200, 10000=0.00100 (USD); Mount: Surface Mount; Case/Package: 0402; Contact Plating: Tin,Matte; Case Code (Imperial): 0402; Case Code (Metric): 1005; Size Code: 0402; Min Operating Temperature: -55°C; Max Operating Temperature: 155°C; Resistance: 0R; Resistor Type: Thick Film; Packaging: Tape and Reel; Termination: SMD/SMT; Features: Moisture Resistant; Series: RC; Number of Terminations: 2; Length: 1mm; Width: 0.5mm; Height: 0.35mm; Radiation Hardening: No; Lead Free: Lead Free; RoHS Compliant: Yes; ComponentLink1URL: https://datasheet.ciiva.com/8896/pyu-rc0402-51-rohs-l-6-8896149.pdf?src-supplier=Avnet; ComponentLink1Description: https://datasheet.ciiva.com/8896/pyu-rc0402-51-rohs-l-6-8896149.pdf?src-supplier=Avnet; ComponentLink2URL: https://datasheet.ciiva.com/16790/pyu-rc0402-51-rohs-l-6-r-16790444.pdf?src-supplier=Future+Electronics; ComponentLink2Description: https://datasheet.ciiva.com/16790/pyu-rc0402-51-rohs-l-6-r-16790444.pdf?src-supplier=Future+Electronics; Supplier Part Number 1: 603-RC0402FR-070RL; LCSC Part Number: C106231
R2 = RC0402FR-0749K9L: RES 49.9K OHM 1% 1/16W 0402; Manufacturer: Yageo; Power Rating: 62.5mW; Value: 49.9kR; Voltage Rating: 50V; Temperature Coefficient: 100ppm/°C; Max Power Dissipation: 63mW; Item Type: Resistor; Supplier: Digikey; Supplier Part Number: 311-49.9KLRCT-ND; Manufacturer Part Number: RC0402FR-0749K9L; RoHS: Yes; Category: Chip SMD Resistors; Stock: 5084418; Pricing: 1=0.1, 10=0.015, 50=0.0088, 100=0.0073, 500=0.00488, 1000=0.00417, 5000=0.00297 (USD); Case/Package: 0402; Case Code (Imperial): 0402; Case Code (Metric): 1005; Min Operating Temperature: -55°C; Max Operating Temperature: 155°C; Tolerance: 1%; Packaging: Tape and Reel; Termination: SMD/SMT; Voltage Rating (DC): 50V; Features: Moisture Resistant; Series: RC; Number of Terminations: 2; Construction: Rectangular; Length: 1mm; Depth: 0.5mm; RoHS Compliant: Yes; Military Standard: Not; Lead Free: Lead Free; ComponentLink1URL: https://datasheet.ciiva.com/17071/pyu-rc0402-51-rohs-l-6-r-17071066.pdf?src-supplier=Future+Electronics; ComponentLink1Description: https://datasheet.ciiva.com/17071/pyu-rc0402-51-rohs-l-6-r-17071066.pdf?src-supplier=Future+Electronics; LCSC Part Number: C137969
R55 R109 R209-R212 R216-R219 R221-R223 R228-R232 = RC0402FR-0710KL: as R198 on sheet Sensors-Sheet-1; Supplier 1: Mouser; Manufacturer Part Number: RC0402FR-0710KL; RoHS: Yes; Category: Chip SMD Resistors; Stock 1: 18648329; Pricing 1: 1=0.10000, 10=0.01400, 50=0.01400, 100=0.00500, 1000=0.00300, 10000=0.00200 (USD); Case/Package: 0402; Number of Pins: 2; Case Code (Imperial): 0402; Case Code (Metric): 1005; Min Operating Temperature: -55°C; Max Operating Temperature: 155°C; Resistor Type: Thick Film; Tolerance: 1%; Packaging: Tape and Reel; Voltage Rating: 50V; Termination: SMD/SMT; Working Voltage: 50V; Number of Terminations: 2; Features: Moisture Resistant; Series: RC; Resistance Tolerance: 1%; Construction: Rectangular; Length: 1mm; Width: 0.5mm; Height: 0.32mm; Depth: 0.5mm; Lead Pitch: 0.2mm; REACH SVHC: No SVHC; Lead Free: Lead Free; RoHS Compliant: Yes; Military Standard: Not; ComponentLink1URL: https://datasheet.ciiva.com/7660/38568-7660787.pdf?src-supplier=Element14; ComponentLink1Description: https://datasheet.ciiva.com/7660/38568-7660787.pdf?src-supplier=Element14; ComponentLink2URL: https://datasheet.ciiva.com/7849/1686128-7849814.pdf?src-supplier=Element14; ComponentLink2Description: https://datasheet.ciiva.com/7849/1686128-7849814.pdf?src-supplier=Element14; ComponentLink3URL: https://datasheet.ciiva.com/7983/1018594-7983486.pdf?src-supplier=Element14; ComponentLink3Description: https://datasheet.ciiva.com/7983/1018594-7983486.pdf?src-supplier=Element14; ComponentLink4URL: https://datasheet.ciiva.com/22747/1018594-22747512.pdf?src-supplier=Element14; ComponentLink4Description: https://datasheet.ciiva.com/22747/1018594-22747512.pdf?src-supplier=Element14; ComponentLink5URL: https://datasheet.ciiva.com/12667/pyu-rc0402-51-rohs-l-6-r-12667067.pdf?src-supplier=Mouser; ComponentLink5Description: https://datasheet.ciiva.com/12667/pyu-rc0402-51-rohs-l-6-r-12667067.pdf?src-supplier=Mouser; ComponentLink6URL: https://datasheet.ciiva.com/7849/1784430-7849813.pdf?src-supplier=Element14; ComponentLink6Description: https://datasheet.ciiva.com/7849/1784430-7849813.pdf?src-supplier=Element14; ComponentLink7URL: https://datasheet.ciiva.com/7849/1784430-7849815.pdf?src-supplier=Element14; ComponentLink7Description: https://datasheet.ciiva.com/7849/1784430-7849815.pdf?src-supplier=Element14; Supplier Part Number 1: 603-RC0402FR-0710KL; LCSC Part Number: C60490
R205-R208 R213-R215 = RC0402FR-071KL: RES 1K OHM 1% 1/16W 0402; Manufacturer: Yageo; Resistance: 1kR; Temperature Coefficient: 100ppm/°C; Voltage Rating (DC): 50V; Power Rating: 62.5mW; Max Power Dissipation: 63mW; Item Type: Resistor; Supplier 1: Avnet; Manufacturer Part Number: RC0402FR-071KL; RoHS: Yes; Category: Chip SMD Resistors; Stock 1: 13030000; Pricing 1: 10000=0.00085, 20000=0.00087, 40000=0.00084, 60000=0.00083, 80000=0.00079, 100000=0.00078, 1000000=0.00076 (USD); Case/Package: 0402; Number of Pins: 2; Case Code (Imperial): 0402; Case Code (Metric): 1005; Size Code: 0402; Min Operating Temperature: -55°C; Max Operating Temperature: 155°C; Resistor Type: Thick Film; Tolerance: 1%; Packaging: Tape and Reel; Voltage Rating: 50V; Termination: SMD/SMT; Features: Moisture Resistant; Series: RC; Number of Terminations: 2; Resistance Tolerance: 1%; Construction: Rectangular; Technology: THICK FILM; Length: 1mm; Width: 0.5mm; Height: 0.32mm; Depth: 0.5mm; Reach SVHC Compliant: Yes; Lead Free: Lead Free; RoHS Compliant: Yes; Military Standard: Not; ComponentLink1URL: https://datasheet.ciiva.com/11819/0900766b80c66297-11819477.pdf?src-supplier=RSComponents; ComponentLink1Description: https://datasheet.ciiva.com/11819/0900766b80c66297-11819477.pdf?src-supplier=RSComponents; ComponentLink2URL: https://datasheet.ciiva.com/7983/1018594-7983502.pdf?src-supplier=Element14; ComponentLink2Description: https://datasheet.ciiva.com/7983/1018594-7983502.pdf?src-supplier=Element14; ComponentLink3URL: https://datasheet.ciiva.com/22747/1018594-22747513.pdf?src-supplier=Element14; ComponentLink3Description: https://datasheet.ciiva.com/22747/1018594-22747513.pdf?src-supplier=Element14; ComponentLink4URL: https://datasheet.ciiva.com/12666/pyu-rc0402-51-rohs-l-6-r-12666741.pdf?src-supplier=Mouser; ComponentLink4Description: https://datasheet.ciiva.com/12666/pyu-rc0402-51-rohs-l-6-r-12666741.pdf?src-supplier=Mouser; ComponentLink5URL: https://datasheet.ciiva.com/7849/1018594-7849869.pdf?src-supplier=Element14; ComponentLink5Description: https://datasheet.ciiva.com/7849/1018594-7849869.pdf?src-supplier=Element14; ComponentLink6URL: https://datasheet.ciiva.com/7849/1018594-7849871.pdf?src-supplier=Element14; ComponentLink6Description: https://datasheet.ciiva.com/7849/1018594-7849871.pdf?src-supplier=Element14; ComponentLink7URL: https://datasheet.ciiva.com/17063/pyu-rc0402-51-rohs-l-6-r-17063193.pdf?src-supplier=Future+Electronics; ComponentLink7Description: https://datasheet.ciiva.com/17063/pyu-rc0402-51-rohs-l-6-r-17063193.pdf?src-supplier=Future+Electronics; Supplier Part Number 1: RC0402FR-071KL; LCSC Part Number: C106235
R224 R225 = RC0603FR-07100RL: RES SMD 100 OHM 1% 1/10W 0603; Manufacturer: Yageo; Temperature Coefficient: 100ppm/°C; Voltage Rating (DC): 50V; Power Rating: 100mW; Item Type: Resistor; Supplier 1: Arrow Electronics; Manufacturer Part Number: RC0603FR-07100RL; RoHS: Yes; Category: Chip SMD Resistors; Stock 1: 3800000; Pricing 1: 5000=0.00300, 5000=0.00200, 5000=0.00450, 50000=0.00410, 500000=0.00230, 2500000=0.00140 (USD); Case/Package: 0603; Number of Pins: 2; Case Code (Imperial): 0603; Case Code (Metric): 1608; Size Code: 0603; Min Operating Temperature: -55°C; Max Operating Temperature: 155°C; Resistance: 100R; Tolerance: 1%; Resistor Type: Thick Film; Packaging: Tape and Reel; Voltage Rating: 50V; Termination: SMD/SMT; Features: Moisture Resistant; Series: RC; Max Power Dissipation: 100mW; Number of Terminations: 2; Construction: Rectangular; Resistance Tolerance: 1%; Technology: THICK FILM; Length: 1.6mm; Width: 0.8mm; Height: 0.45mm; Depth: 0.8mm; REACH SVHC: Unknown; Lead Free: Lead Free; RoHS Compliant: Yes; Military Standard: Not; Supplier Part Number 1: RC0603FR-07100RL; LCSC Part Number: C105588
R226 = RC0603FR-0722RL: RES 22 OHM 1% 1/10W 0603; Manufacturer: Yageo; Temperature Coefficient: 100ppm/°C; Voltage Rating (DC): 50V; Power Rating: 100mW; Item Type: Resistor; Supplier 1: Avnet; Manufacturer Part Number: RC0603FR-0722RL; RoHS: Yes; Category: Chip SMD Resistors; Stock 1: 190000; Pricing 1: 5000=0.00133, 10000=0.00131, 20000=0.00127 (USD); Case/Package: 0603; Number of Pins: 2; Case Code (Metric): 1608; Case Code (Imperial): 0603; Size Code: 0603; Min Operating Temperature: -55°C; Max Operating Temperature: 155°C; Tolerance: 1%; Resistance: 22R; Resistor Type: Thick Film; Packaging: Tape and Reel; Voltage Rating: 50V; Package Quantity: 1; Number of Terminations: 2; Termination: SMD/SMT; Max Power Dissipation: 100mW; Features: Moisture Resistant; Series: RC; Resistance Tolerance: 1%; Technology: THICK FILM; Construction: Rectangular; Length: 0.063inch; Width: 0.031inch; Height: 0.022inch; Depth: 0.8mm; Reach SVHC Compliant: Yes; Lead Free: Lead Free; Military Standard: Not; RoHS Compliant: Yes; ComponentLink1URL: https://datasheet.ciiva.com/11819/0900766b80f96399-11819285.pdf?src-supplier=RSComponents; ComponentLink1Description: https://datasheet.ciiva.com/11819/0900766b80f96399-11819285.pdf?src-supplier=RSComponents; ComponentLink2URL: https://datasheet.ciiva.com/46395/443971-46395032.pdf?src-supplier=Element14; ComponentLink2Description: https://datasheet.ciiva.com/46395/443971-46395032.pdf?src-supplier=Element14; ComponentLink3URL: https://datasheet.ciiva.com/46440/1868787-46440901.pdf?src-supplier=Element14; ComponentLink3Description: https://datasheet.ciiva.com/46440/1868787-46440901.pdf?src-supplier=Element14; ComponentLink4URL: https://datasheet.ciiva.com/2454/pyu-r-int-thick-7-2454355.pdf?src-supplier=Digi-Key; ComponentLink4Description: https://datasheet.ciiva.com/2454/pyu-r-int-thick-7-2454355.pdf?src-supplier=Digi-Key; ComponentLink5URL: https://datasheet.ciiva.com/2454/pyu-r-int-thick-7-2454356.pdf?src-supplier=Digi-Key; ComponentLink5Description: https://datasheet.ciiva.com/2454/pyu-r-int-thick-7-2454356.pdf?src-supplier=Digi-Key; ComponentLink6URL: https://datasheet.ciiva.com/2454/pyu-r-int-thick-7-2454354.pdf?src-supplier=Digi-Key; ComponentLink6Description: https://datasheet.ciiva.com/2454/pyu-r-int-thick-7-2454354.pdf?src-supplier=Digi-Key; Supplier Part Number 1: RC0603FR-0722RL; LCSC Part Number: C107701
R227 = RC0603FR-076R8L: RES SMD 6.8 OHM 1% 1/10W 0603; Manufacturer: Yageo; Voltage Rating (DC): 50V; Power Rating: 100mW; Temperature Coefficient: 200ppm/°C; Item Type: Resistor; Supplier 1: Future Electronics; Manufacturer Part Number: RC0603FR-076R8L; RoHS: Yes; Category: Chip SMD Resistors; Stock 1: 265000; Pricing 1: 5000=0.00320, 25000=0.00300, 125000=0.00280, 375000=0.00270, 1000000=0.00250 (USD); Case/Package: 0603; Pins: 2; Case Code (Imperial): 0603; Case Code (Metric): 1608; Min Operating Temperature: -55°C; Max Operating Temperature: 155°C; Packaging: Tape and Reel; Value: 6.8R; Tolerance: 1%; Voltage Rating: 50V; Resistor Type: Thick Film; Termination: SMD/SMT; Number of Terminations: 2; Max Power Dissipation: 100mW; Features: Moisture Resistant; Series: RC; Resistance Tolerance: 1%; Length: 0.063inch; Width: 0.031inch; Height: 0.022inch; Reach SVHC Compliant: Yes; Lead Free: Lead Free; RoHS Compliant: Yes; ComponentLink1URL: https://datasheet.ciiva.com/6169/1686128-6169033.pdf?src-supplier=Farnell; ComponentLink1Description: https://datasheet.ciiva.com/6169/1686128-6169033.pdf?src-supplier=Farnell; ComponentLink2URL: https://datasheet.ciiva.com/7746/443971-7746398.pdf?src-supplier=Element14; ComponentLink2Description: https://datasheet.ciiva.com/7746/443971-7746398.pdf?src-supplier=Element14; ComponentLink3URL: https://datasheet.ciiva.com/7746/443971-7746399.pdf?src-supplier=Element14; ComponentLink3Description: https://datasheet.ciiva.com/7746/443971-7746399.pdf?src-supplier=Element14; LCSC Part Number: C185313; Supplier Part Number 1: 7001845
U26-U32 = PC817C: 70V 5kV 50mA 100mV@1mA,20mA 1 6V 1.2V DC SMD-4 Transistor Output Optocoupler ROHS; Manufacturer: Slkor; Item Type: IC; Manufacturer Part Number: PC817C; Package: SMD-4; LCSC Part Number: C2936043; ComponentLink1Description: LCSC; ComponentLink1URL: https://www.lcsc.com/product-detail/Transistor-Output-Optocoupler_Slkor-SLKORMICRO-Elec-PC817C_C2936043.html
U33 = ADS1015IDGSR: IC ADC 12BIT SIGMA-DELTA 10VSSOP; Manufacturer: Texas Instruments; Operating Supply Voltage: 3.3V; Min Supply Voltage: 2V; Max Supply Voltage: 5.5V; Interface: I2C; Number of Converters: 1; Resolution: 12b; Number of Bits: 12; Sampling Rate: 3.3KS/s; Polarity: Bipolar; Integral Nonlinearity (INL): 0.5LSB; Supply Type: Single; Number of Inputs: 4; Power Dissipation: 900uW; Supplier: Mouser; Supplier Part Number: 595-ADS1015IDGSR; Manufacturer Part Number: ADS1015IDGSR; RoHS: Yes; Item Type: IC; Stock: 6946; Pricing: 1=2.68, 10=2.28, 50=2.28, 100=1.98, 1000=1.42, 10000=1.32 (USD); Case/Package: VSSOP; Pins: 10; Contact Plating: Gold; Min Operating Temperature: -40°C; Max Operating Temperature: 125°C; Packaging: Tape and Reel; Package Quantity: 2500; Number of A/D Converters: 1; Number of Elements: 1; Conversion Rate: 3.3KS/s; Max Supply Voltage (DC): 5.5V; Min Supply Voltage (DC): 2V; Series: -; Length: 3mm; Width: 3mm; Height: 1.07mm; Thickness: 1.02mm; Reach SVHC Compliant: No; Lead Free: Lead Free; RoHS Compliant: Yes; ComponentLink1URL: https://datasheet.ciiva.com/14260/sbas473c-14260076.pdf?src-supplier=Avnet; ComponentLink1Description: https://datasheet.ciiva.com/14260/sbas473c-14260076.pdf?src-supplier=Avnet; ComponentLink2URL: https://datasheet.ciiva.com/6662/ads1013-6662716.pdf?src-supplier=Digikey; ComponentLink2Description: https://datasheet.ciiva.com/6662/ads1013-6662716.pdf?src-supplier=Digikey; LCSC Part Number: C193969
U34 = MCP23017T-E/SS: IC XPNDR 1.7MHZ I2C 28SSOP; Manufacturer: Microchip; Operating Supply Voltage: 5.5V; Interface: I2C,Serial; Number of Channels: 1; Output Current: 25mA; Number of I/Os: 16; Power Dissipation: 700mW; Clock Frequency: 10MHz; Output Type: PUSH-PULL; Supply Current: 1mA; Supplier 1: Digi-Key; Manufacturer Part Number: MCP23017T-E/SS; RoHS: Yes; Category: Interface ICs; Stock 1: 26314; Pricing 1: 1=1.69, 25=1.4, 100=1.28 (USD); Mounting Technology: Surface Mount; Case/Package: SSOP; Pins: 28; Min Operating Temperature: -40°C; Max Operating Temperature: 125°C; Package Quantity: 2100; Series: -; Packaging: Tape and Reel; Frequency: 1.7MHz; Number of Bits: 16; Nominal Supply Voltage: 5.5V; Lead Free: Lead Free; RoHS Compliant: Yes; ComponentLink1URL: https://datasheet.ciiva.com/12267/21952b-12267583.pdf?src-supplier=Mouser; ComponentLink1Description: https://datasheet.ciiva.com/12267/21952b-12267583.pdf?src-supplier=Mouser; ComponentLink2URL: https://datasheet.ciiva.com/8128/21952b-8128586.pdf?src-supplier=Avnet; ComponentLink2Description: https://datasheet.ciiva.com/8128/21952b-8128586.pdf?src-supplier=Avnet; ComponentLink3URL: https://datasheet.ciiva.com/16454/filehandler-aspxddocname-en023709-16454267.pdf?src-supplier=Future+Electronics; ComponentLink3Description: https://datasheet.ciiva.com/16454/filehandler-aspxddocname-en023709-16454267.pdf?src-supplier=Future+Electronics; ComponentLink4URL: https://datasheet.ciiva.com/1780/21952b-1780738.pdf?src-supplier=Digi-Key; ComponentLink4Description: https://datasheet.ciiva.com/1780/21952b-1780738.pdf?src-supplier=Digi-Key; Supplier Part Number 1: MCP23017T-E/SSCT-ND; LCSC Part Number: C558584; Item Type: IC
U35 = PCA9536D,118: 400kHz SO-8 I/O Expanders ROHS; Manufacturer: NXP Semiconductors; Number of I/Os: 4; Interface: I2C,SMBus,Serial; Output Current: 50mA; Operating Supply Voltage: 5.5V; Operating Supply Current: 85mA; Max Power Dissipation: 200mW; Item Type: IC; Supplier: Avnet; Supplier Part Number: PCA9536D,118; Manufacturer Part Number: PCA9536D,118; RoHS: Yes; Category: Interface ICs; Stock: 96987; Pricing: 494=0.72487, 500=0.70966, 990=0.68938, 2500=0.67925, 5000=0.66404, 25000=0.64883, 50000=0.62856 (USD); Mounting Technology: Surface Mount; Case/Package: SO; Pins: 8; Weight: 0.01787oz; Min Operating Temperature: -40°C; Max Operating Temperature: 85°C; Packaging: Tape and Reel; Package Quantity: 1; Clock Frequency: 400kHz; Frequency: 400kHz; Series: -; Nominal Supply Voltage: 5.5V; Supply Current: 85mA; Lead Free: Lead Free; RoHS Compliant: Yes; ComponentLink1URL: https://datasheet.ciiva.com/8125/pca9536-8125671.pdf?src-supplier=Avnet; ComponentLink1Description: https://datasheet.ciiva.com/8125/pca9536-8125671.pdf?src-supplier=Avnet; ComponentLink2URL: https://datasheet.ciiva.com/1779/pca9536-1779979.pdf?src-supplier=Digi-Key; ComponentLink2Description: https://datasheet.ciiva.com/1779/pca9536-1779979.pdf?src-supplier=Digi-Key; ComponentLink3URL: https://datasheet.ciiva.com/1779/pca9536-1779980.pdf?src-supplier=Digi-Key; ComponentLink3Description: https://datasheet.ciiva.com/1779/pca9536-1779980.pdf?src-supplier=Digi-Key; ComponentLink4URL: https://datasheet.ciiva.com/1779/pca9536-1779981.pdf?src-supplier=Digi-Key; ComponentLink4Description: https://datasheet.ciiva.com/1779/pca9536-1779981.pdf?src-supplier=Digi-Key; ComponentLink5URL: https://datasheet.ciiva.com/3148/pca9536-3148502.pdf?src-supplier=Avnet; ComponentLink5Description: https://datasheet.ciiva.com/3148/pca9536-3148502.pdf?src-supplier=Avnet; ComponentLink6URL: https://datasheet.ciiva.com/3149/pca9536-3149304.pdf?src-supplier=Avnet; ComponentLink6Description: https://datasheet.ciiva.com/3149/pca9536-3149304.pdf?src-supplier=Avnet; ComponentLink7URL: https://datasheet.ciiva.com/16291/pca9536-16291035.pdf?src-supplier=Future+Electronics; ComponentLink7Description: https://datasheet.ciiva.com/16291/pca9536-16291035.pdf?src-supplier=Future+Electronics; LCSC Part Number: C2688883